# Altium project Alarm-Clock-v1.1.PrjPcb (part 4 of 4)

## Sheet ADC-GPIO-Expand-Sheet.SchDoc
size A4; SheetNumber: 6; SheetTotal: 6
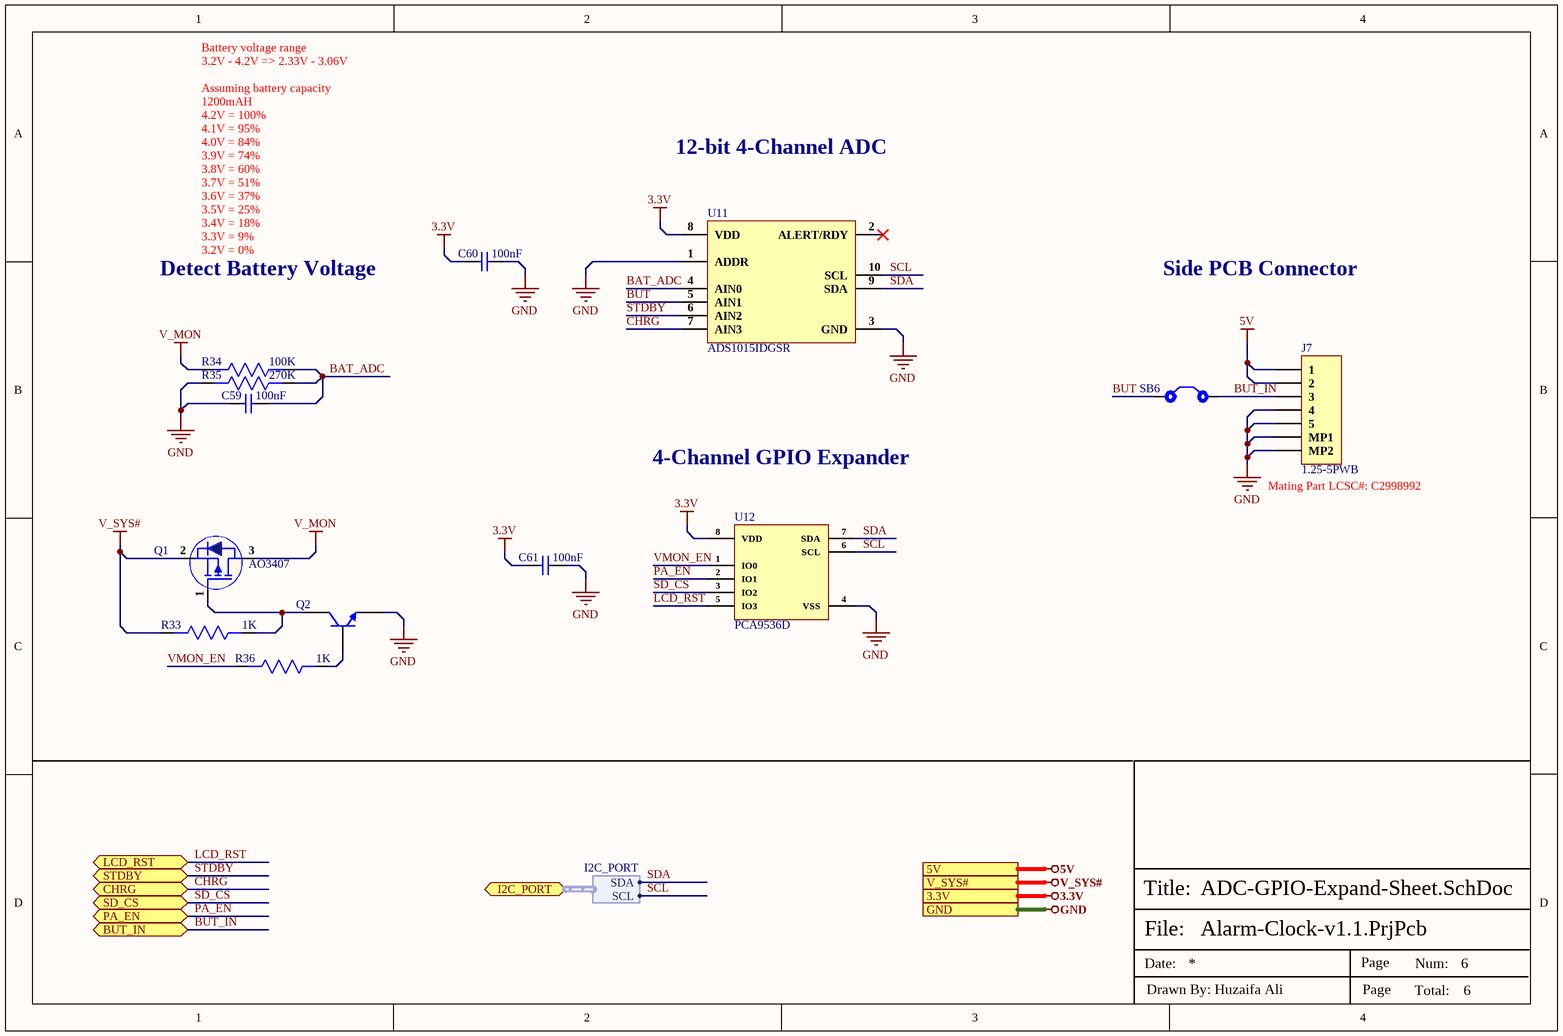
[diagram p5: ADC-GPIO-Expand-Sheet.SchDoc]

### Parts
C59  100nF  [Cap-0402]
C60  100nF  [Cap-0402]
C61  100nF  [Cap-0402]
J7  1.25-5PWB  [1.25-5PWB]
Q1  AO3407  [SOT-23]
Q2  MMBT2222A-7-F  [SOT-23]  (value not drawn)
R33  1K  [Res-0603]
R34  100K  [Res-0603]
R35  270K  [Res-0603]
R36  1K  [Res-0603]
SB6  Solder Bridge 0402  [Solder Bridge 0402]  (value not drawn)
U11  ADS1015IDGSR  [VSSOP-10]
U12  PCA9536D  [SOIC-8]

### Ports
3.3V, 5V, BUT_IN (bidir), CHRG (bidir), GND, I2C_PORT (bidir, harness I2C_PORT), LCD_RST (bidir), PA_EN (bidir), SD_CS (bidir), STDBY (bidir), V_SYS#

### Harnesses
I2C_PORT: SDA, SCL

### Nets
3.3V: C60.1 C61.1 U11.8(VDD) U12.8(VDD) ; port 3.3V
5V: J7.1 J7.2 ; port 5V
GND: C59.1 C60.2 C61.2 J7.4 J7.5 J7.MP1 J7.MP2 Q2.2(E) R35.2 U11.1(ADDR) U11.3(GND) U12.4(VSS) ; port GND
V_MON: Q1.3(D) R34.2
V_SYS#: Q1.2(S) R33.2 ; port V_SYS#
BAT_ADC: C59.2 R34.1 R35.1 U11.4(AIN0)
BUT: SB6.1 U11.5(AIN1)
BUT_IN: J7.3 SB6.2 ; port BUT_IN
CHRG: U11.7(AIN3) ; port CHRG
LCD_RST: U12.5(IO3) ; port LCD_RST
PA_EN: U12.2(IO1) ; port PA_EN
SCL: U11.10(SCL) U12.6(SCL) ; port I2C_PORT.SCL  [project net I2C_PORT.SCL]
SD_CS: U12.3(IO2) ; port SD_CS
SDA: U11.9(SDA) U12.7(SDA) ; port I2C_PORT.SDA  [project net I2C_PORT.SDA]
STDBY: U11.6(AIN2) ; port STDBY
VMON_EN: R36.2 U12.1(IO0)
NetQ1_1: Q1.1(G) Q2.3(C) R33.1
NetQ2_1: Q2.1(B) R36.1

Not connected (* = marked no-connect by the designer): U11 2(ALERT/RDY)*

### Notes on the sheet
- 12-bit 4-Channel ADC
- Battery voltage range
  3.2V - 4.2V => 2.33V - 3.06V
  Assuming battery capacity 1200mAH
  4.2V = 100%
  4.1V = 95%
  4.0V = 84%
  3.9V = 74%
  3.8V = 60%
  3.7V = 51%
  3.6V = 37%
  3.5V = 25%
  3.4V = 18%
  3.3V = 9%
  3.2V = 0%
- Detect Battery Voltage
- Side PCB Connector
- 4-Channel GPIO Expander
- (near J7) Mating Part LCSC#: C2998992
- File:
- Title:
- Date:
- Page
- Num:
- Total:
- Drawn By: Huzaifa Ali

### Library data of the parts
C59-C61 = CC0402KRX5R8BB104: CAP CER 0.1UF 25V X5R 0402; Manufacturer: Yageo; Tolerance: 10%; Item Type: Capacitor; Supplier 1: Digi-Key; Manufacturer Part Number: CC0402KRX5R8BB104; RoHS: Yes; Category: Ceramic Capacitors; Stock 1: 4598218; Pricing 1: 1=0.10000, 10=0.03800, 50=0.02100, 100=0.01710, 500=0.01224, 1000=0.00961, 2500=0.00874, 5000=0.00804 (USD); Mount: Surface Mount; Case/Package: 0402; Case Code (Metric): 1005; Case Code (Imperial): 0402; Min Operating Temperature: -55°C; Max Operating Temperature: 85°C; Voltage Rating: 25V; Packaging: Tape and Reel; Capacitance: 100nF; Voltage Rating (DC): 25V; Dielectric: X5R; Resistor Type: Ceramic; Series: CC; Length: 0.039inch; Width: 0.02inch; Thickness: 0.022inch; Depth: 0.5mm; Lead Free: Lead Free; Halogen Free: Halogen Free; RoHS Compliant: Yes; ComponentLink1URL: http://www.mouser.com/ds/2/447/UPY-GPHC_X5R_4V-to-50V_25-1131599.pdf?src-supplier=Mouser; ComponentLink1Description: http://www.mouser.com/ds/2/447/UPY-GPHC_X5R_4V-to-50V_25-1131599.pdf?src-supplier=Mouser; ComponentLink2URL: http://www.yageo.com/documents/recent/UPY-GPHC_X5R_4V-to-50V-16.pdf?src-supplier=Future+Electronics; ComponentLink2Description: http://www.yageo.com/documents/recent/UPY-GPHC_X5R_4V-to-50V-16.pdf?src-supplier=Future+Electronics; ComponentLink3URL: http://www.yageo.com/documents/recent/UPY-GPHC_X5R_4V-to-50V_25.pdf?src-supplier=Digi-Key; ComponentLink3Description: http://www.yageo.com/documents/recent/UPY-GPHC_X5R_4V-to-50V_25.pdf?src-supplier=Digi-Key; Supplier Part Number 1: 311-1697-1-ND; LCSC Part Number: C106256
J7 = 1.25-5PWB: 1x5P 1 1.25mm Male pin 5 -25℃~+85℃ Surface Mount SMD,P=1.25mm Wire To Board / Wire To Wire Connector ROHS; Manufacturer: DEALON; Item Type: JST Right Angle; Manufacturer Part Number: 1.25-5PWB; Package: SMD,P=1.25mm; LCSC Part Number: C2905012; ComponentLink1Description: LCSC; ComponentLink1URL: https://www.lcsc.com/product-detail/Wire-To-Board-Wire-To-Wire-Connector_DEALON-1-25-5PWB_C2905012.html
Q1 = AO3407: 30V 4.1A 60mΩ@10V,4.1A 350mW 3V@250uA P Channel SOT-23 MOSFETs ROHS; Manufacturer: Guangdong Hottech; Item Type: Mosfet; Manufacturer Part Number: AO3407; Package: SOT-23; LCSC Part Number: C181093; ComponentLink1Description: LCSC; ComponentLink1URL: https://www.lcsc.com/product-detail/MOSFETs_Guangdong-Hottech-AO3407_C181093.html
Q2 = MMBT2222A-7-F: TRANS NPN 40V 0.6A SMD SOT23-3; Manufacturer: Diodes; Max Power Dissipation: 300mW; Collector Base Voltage (VCBO): 75V; Max Collector Current: 600mA; hFE Min: 100; Frequency: 300MHz; Number of Elements: 1; Emitter Base Voltage (VEBO): 6V; Collector Emitter Saturation Voltage: 1V; Power Dissipation: 350mW; Element Configuration: Single; Current: 1A; Supplier 1: Digi-Key; Manufacturer Part Number: MMBT2222A-7-F; Stock 1: 2471182; Pricing 1: 1=0.15, 10=0.134, 100=0.0729, 500=0.04486, 1000=0.03059 (USD); Mount: Surface Mount; Case/Package: SOT-23; Number of Pins: 3; Weight: 0.000282oz; Contact Plating: Matte,Tin; Min Operating Temperature: -55°C; Max Operating Temperature: 150°C; Packaging: Tape and Reel; Collector Emitter Voltage (VCEO): 40V; Polarity: NPN; Voltage Rating (DC): 40V; Package Quantity: 3000; Continuous Collector Current: 600mA; Collector Emitter Breakdown Voltage: 40V; Transition Frequency: 300MHz; Max Breakdown Voltage: 40V; Max Frequency: 300MHz; Termination: SMD/SMT; Gain Bandwidth Product: 300MHz; Current Rating: 600mA; Voltage: 40V; Length: 3.05mm; Height: 1mm; Width: 1.4mm; Radiation Hardening: No; Lead Free: Lead Free; REACH SVHC: No SVHC; ComponentLink1URL: http://www.diodes.com/datasheets/ds30041.pdf?src-supplier=Future+Electronics; ComponentLink1Description: http://www.diodes.com/datasheets/ds30041.pdf?src-supplier=Future+Electronics; ComponentLink2URL: http://www.diodes.com/datasheets/ds30041.pdf?src-supplier=Avnet; ComponentLink2Description: http://www.diodes.com/datasheets/ds30041.pdf?src-supplier=Avnet; ComponentLink3URL: https://www.verical.com/server-webapp/html/getDatasheet?partID=82692&src-supplier=Verical; ComponentLink3Description: https://www.verical.com/server-webapp/html/getDatasheet?partID=82692&src-supplier=Verical; ComponentLink4URL: https://www.diodes.com/assets/Datasheets/ds30041.pdf?src-supplier=Digi-Key; ComponentLink4Description: https://www.diodes.com/assets/Datasheets/ds30041.pdf?src-supplier=Digi-Key; ComponentLink5URL: http://www.diodes.com/datasheets/ds30041.pdf?src-supplier=Avnet+Europe; ComponentLink5Description: http://www.diodes.com/datasheets/ds30041.pdf?src-supplier=Avnet+Europe; ComponentLink6URL: http://www.diodes.com/datasheets/ds30041.pdf?src-supplier=Element14; ComponentLink6Description: http://www.diodes.com/datasheets/ds30041.pdf?src-supplier=Element14; Supplier Part Number 1: MMBT2222A-FDIDKR-ND; LCSC Part Number: C94515
R33 R36 = RC0603FR-071KL: RES SMD 1K OHM 1% 1/10W 0603; Manufacturer: Yageo; Resistance: 1kR; Temperature Coefficient: 100ppm/°C; Power Rating: 100mW; Voltage Rating: 50V; ComponentLink1URL: https://www.verical.com/server-webapp/html/getDatasheet?partID=409289&src-supplier=Verical; ComponentLink1Description: https://www.verical.com/server-webapp/html/getDatasheet?partID=409289&src-supplier=Verical; Supplier 1: Digi-Key; Manufacturer Part Number: RC0603FR-071KL; Stock 1: 21472395; Pricing 1: 1=0.1, 10=0.023, 100=0.0094, 1000=0.0042, 2500=0.0037 (USD); Case/Package: 0603; Contact Plating: Tin,Matte; Case Code (Imperial): 0603; Case Code (Metric): 1608; Min Operating Temperature: -55°C; Max Operating Temperature: 155°C; Tolerance: 1%; Composition: Thick Film; Packaging: Tape and Reel; Termination: SMD/SMT; Military Standard: Not; Length: 1.6mm; Height: 0.45mm; Depth: 0.8mm; Radiation Hardening: No; REACH SVHC: No SVHC; Lead Free: Lead Free; ComponentLink2URL: http://documents.rs-components.com/techlib://itc_doclist_GB.htm?stockno=5048928&src-supplier=RSComponents; ComponentLink2Description: http://documents.rs-components.com/techlib://itc_doclist_GB.htm?stockno=5048928&src-supplier=RSComponents; ComponentLink3URL: http://www.yageo.com/documents/recent/PYu-RC0603_51_RoHS_L_4.pdf?src-supplier=Avnet+Europe; ComponentLink3Description: http://www.yageo.com/documents/recent/PYu-RC0603_51_RoHS_L_4.pdf?src-supplier=Avnet+Europe; ComponentLink4URL: http://www.farnell.com/datasheets/2167052.pdf?src-supplier=Element14; ComponentLink4Description: http://www.farnell.com/datasheets/2167052.pdf?src-supplier=Element14; ComponentLink5URL: http://www.farnell.com/datasheets/1868787.pdf?src-supplier=Element14; ComponentLink5Description: http://www.farnell.com/datasheets/1868787.pdf?src-supplier=Element14; ComponentLink6URL: http://www.yageo.com/documents/recent/PYu-RC_Group_51_RoHS_L_2.pdf?src-supplier=Avnet; ComponentLink6Description: http://www.yageo.com/documents/recent/PYu-RC_Group_51_RoHS_L_2.pdf?src-supplier=Avnet; ComponentLink7URL: https://www.verical.com/server-webapp/html/getDatasheet?partID=404327&src-supplier=Verical; ComponentLink7Description: https://www.verical.com/server-webapp/html/getDatasheet?partID=404327&src-supplier=Verical; ComponentLink8URL: http://www.farnell.com/datasheets/443971.pdf?src-supplier=Element14; ComponentLink8Description: http://www.farnell.com/datasheets/443971.pdf?src-supplier=Element14; Supplier Part Number 1: 311-1.00KHRDKR-ND; LCSC Part Number: C22548
R34 = RT0603BRD07100KL: RES SMD 100K OHM 0.1% 1/10W 0603; Manufacturer: Yageo; Resistance: 100kR; Temperature Coefficient: 25ppm/°C; Voltage Rating (DC): 75V; Power Rating: 100mW; Supplier 1: Digi-Key; Manufacturer Part Number: RT0603BRD07100KL; Stock 1: 53395; Pricing 1: 1=0.39, 10=0.332, 100=0.1298, 1000=0.05435, 2500=0.04982 (USD); Mount: Surface Mount; Case/Package: 0603; Case Code (Imperial): 0603; Case Code (Metric): 1608; Min Operating Temperature: -55°C; Max Operating Temperature: 125°C; Tolerance: 0.1%; Composition: Thin Film; Packaging: Tape and Reel; Voltage Rating: 75V; Package Quantity: 5000; Termination: SMD/SMT; Number of Terminations: 2; Military Standard: Not; Max Power Dissipation: 100mW; Working Voltage: 75V; Features: Moisture Resistant; Length: 1.6mm; Height: 0.022inch; Width: 0.031inch; Depth: 0.8mm; Lead Free: Lead Free; ComponentLink1URL: http://documents.rs-components.com/techlib://itc_doclist_GB.htm?stockno=6174810&src-supplier=RSComponents; ComponentLink1Description: http://documents.rs-components.com/techlib://itc_doclist_GB.htm?stockno=6174810&src-supplier=RSComponents; Supplier Part Number 1: YAG1235CT-ND; LCSC Part Number: C122538
R35 = RC0603DR-07270KL: RES 270K OHM 0.5% 1/10W 0603; Manufacturer: Yageo; Additional Feature: LASER TRIMMABLE; Power: 100mW; Rated Temperature: 70°C; Value: 270kR; Temperature Coefficient: 100ppm/°C; Working Voltage: 75V; Package Height: 0.45mm; Package Length: 1.6mm; Package Width: 0.8mm; Item Type: Resistor; Supplier 1: Mouser; Manufacturer Part Number: RC0603DR-07270KL; RoHS: Yes; Category: Chip SMD Resistors; Stock 1: 13684; Pricing 1: 1=0.21000, 10=0.07000, 50=0.07000, 100=0.02900, 1000=0.01500, 10000=0.00900 (USD); Mounting Technology: Surface Mount; Pins: 2; Package Shape: Rectangular; Case/Package: 0603; Terminal Finish: Nickel; Min Operating Temperature: -55°C; Max Operating Temperature: 155°C; Tolerance: 0.5%; JESD-609 Code: e3; Resistor Type: FIXED RESISTOR; Construction: Chip; Package Style: SMTMeter; Packaging: Tape and Reel; Technology: METAL GLAZE/THICK FILM; Termination: Wraparound; Reach SVHC Compliant: Yes; RoHS Compliant: Yes; ComponentLink1URL: https://datasheet.ciiva.com:443/pdfs/VipMasterIC/IC/YAGO/YAGO-S-A0008145938/YAGO-S-A0008145938-1.pdf?src-supplier=IHS+Markit; ComponentLink1Description: https://datasheet.ciiva.com:443/pdfs/VipMasterIC/IC/YAGO/YAGO-S-A0008145938/YAGO-S-A0008145938-1.pdf?src-supplier=IHS+Markit; ComponentLink2URL: http://www.yageo.com.tw/exep/pages/download/literatures/PYu-R_INT-thick_7.pdf?src-supplier=Digi-Key; ComponentLink2Description: http://www.yageo.com.tw/exep/pages/download/literatures/PYu-R_INT-thick_7.pdf?src-supplier=Digi-Key; Supplier Part Number 1: 603-RC0603DR-07270KL; LCSC Part Number: C724006
SB6 = Solder Bridge 0402: Solder Bridge ON; Manufacturer Part Number: Solder Bridge; Item Type: Solder Bridge
U11 = ADS1015IDGSR: IC ADC 12BIT SIGMA-DELTA 10VSSOP; Manufacturer: Texas Instruments; Operating Supply Voltage: 3.3V; Min Supply Voltage: 2V; Max Supply Voltage: 5.5V; Interface: I2C; Number of Converters: 1; Resolution: 12b; Number of Bits: 12; Sampling Rate: 3.3KS/s; Polarity: Bipolar; Integral Nonlinearity (INL): 0.5LSB; Supply Type: Single; Number of Inputs: 4; Power Dissipation: 900uW; Supplier 1: Digi-Key; Manufacturer Part Number: ADS1015IDGSR; RoHS: Yes; Category: Analog to Digital Converters (ADCs); Pricing 1: 1=3.09000, 10=2.77500, 25=2.62360, 100=2.27370, 250=2.15712, 500=1.93556, 1000=1.65000 (USD); Case/Package: VSSOP; Number of Pins: 10; Contact Plating: Gold; Min Operating Temperature: -40°C; Max Operating Temperature: 125°C; Packaging: Tape and Reel; Package Quantity: 2500; Number of A/D Converters: 1; Number of Elements: 1; Conversion Rate: 3.3KS/s; Max Supply Voltage (DC): 5.5V; Min Supply Voltage (DC): 2V; Series: -; Radiation Hardening: No; Reach SVHC Compliant: Yes; Lead Free: Lead Free; RoHS Compliant: Yes; ComponentLink1URL: https://datasheet.ciiva.com/14260/sbas473c-14260076.pdf?src-supplier=Avnet; ComponentLink1Description: https://datasheet.ciiva.com/14260/sbas473c-14260076.pdf?src-supplier=Avnet; ComponentLink2URL: https://datasheet.ciiva.com/6662/ads1013-6662716.pdf?src-supplier=Digi-Key; ComponentLink2Description: https://datasheet.ciiva.com/6662/ads1013-6662716.pdf?src-supplier=Digi-Key; Supplier Part Number 1: 296-41185-1-ND; LCSC Part Number: C193969; Item Type: IC
U12 = PCA9536D: 4 400kHz I²C, SMBus SOIC-8 I/O Expanders ROHS; Manufacturer: NXP Semicon; Item Type: IC; Manufacturer Part Number: PCA9536D; Package: SOIC-8; LCSC Part Number: C129522; ComponentLink1Description: LCSC; ComponentLink1URL: https://www.lcsc.com/product-detail/I-O-Expanders_NXP-Semicon-PCA9536D_C129522.html

## Nets that join several sheets
3.3V: LCD-Sheet (7 pins), Audio-Sheet (FB2.1 FB3.1 R25.1), Power-Sheet (6 pins), Controller-Sheet (10 pins), ADC-GPIO-Expand-Sheet (C60.1 C61.1 U11.8 U12.8)
5V: Power-Sheet (6 pins), ADC-GPIO-Expand-Sheet (J7.1 J7.2)
AGND: Audio-Sheet (40 pins), Power-Sheet (5 pins)
CODEC_3V3: Audio-Sheet (C44.1 C45.1 R24.1), Power-Sheet (C7.1 P5.1 U2.5)
GND: LCD-Sheet (14 pins), Power-Sheet (24 pins), Controller-Sheet (17 pins), ADC-GPIO-Expand-Sheet (12 pins)
V_SYS#: LCD-Sheet (C18.1 C19.1 L1.1 U8.6), Power-Sheet (FB1.2 SW6.3), ADC-GPIO-Expand-Sheet (Q1.2 R33.2)
BUT_IN: Controller-Sheet (R2.2 SW3.2), ADC-GPIO-Expand-Sheet (J7.3 SB6.2)
CHRG: Power-Sheet (R7.1 U3.7), ADC-GPIO-Expand-Sheet (U11.7)
I2C_PORT.SCL: Audio-Sheet (U9.28), Controller-Sheet (R12.1 U7.34), ADC-GPIO-Expand-Sheet (U11.10 U12.6)
I2C_PORT.SDA: Audio-Sheet (U9.27), Controller-Sheet (R11.1 U7.33), ADC-GPIO-Expand-Sheet (U11.9 U12.7)
I2S_DIN: Audio-Sheet (R21.2), Controller-Sheet (U7.36)
I2S_DOUT: Audio-Sheet (R19.2), Controller-Sheet (U7.37)
I2S_LRCK: Audio-Sheet (R20.2), Controller-Sheet (U7.26)
I2S_MCLK: Audio-Sheet (R17.2), Controller-Sheet (U7.35)
I2S_SCLK: Audio-Sheet (R18.2), Controller-Sheet (U7.16)
LCD_BL_EN: LCD-Sheet (R14.1 U8.4), Controller-Sheet (U7.31)
LCD_CS: LCD-Sheet (J4.11), Controller-Sheet (U7.32)
LCD_DB1: LCD-Sheet (J4.17), Controller-Sheet (U7.8)
LCD_DB2: LCD-Sheet (J4.18), Controller-Sheet (U7.22)
LCD_DB3: LCD-Sheet (J4.19), Controller-Sheet (U7.21)
LCD_DB4: LCD-Sheet (J4.20), Controller-Sheet (U7.20)
LCD_DB5: LCD-Sheet (J4.21), Controller-Sheet (U7.19)
LCD_DB6: LCD-Sheet (J4.22), Controller-Sheet (U7.18)
LCD_DB7: LCD-Sheet (J4.23), Controller-Sheet (U7.17)
LCD_DB8: LCD-Sheet (J4.24), Controller-Sheet (U7.12)
LCD_DB9: LCD-Sheet (J4.25), Controller-Sheet (U7.7)
LCD_DB10: LCD-Sheet (J4.26), Controller-Sheet (U7.6)
LCD_DB11: LCD-Sheet (J4.27), Controller-Sheet (U7.5)
LCD_DB13: LCD-Sheet (J4.29), Controller-Sheet (U7.4)
LCD_DB14: LCD-Sheet (J4.30), Controller-Sheet (U7.15)
LCD_DB15: LCD-Sheet (J4.31), Controller-Sheet (U7.38)
LCD_DB16: LCD-Sheet (J4.32), Controller-Sheet (U7.39)
LCD_DB17: LCD-Sheet (J4.33), Controller-Sheet (R9.2 SW2.1 SW2.2 U7.27)
LCD_DE: LCD-Sheet (J4.13), Controller-Sheet (U7.11)
LCD_HSYNC: LCD-Sheet (J4.15), Controller-Sheet (U7.9)
LCD_PCLK: LCD-Sheet (J4.12), Controller-Sheet (U7.23)
LCD_RST: LCD-Sheet (J4.6 R15.1), ADC-GPIO-Expand-Sheet (U12.5)
LCD_SCK: LCD-Sheet (J4.10), Controller-Sheet (U7.25)
LCD_SDA: LCD-Sheet (J4.9), Controller-Sheet (U7.24)
LCD_VSYNC: LCD-Sheet (J4.14), Controller-Sheet (U7.10)
PA_EN: Audio-Sheet (R31.2 U10.1), ADC-GPIO-Expand-Sheet (U12.2)
SD_CS: Controller-Sheet (J3.2), ADC-GPIO-Expand-Sheet (U12.3)
STDBY: Power-Sheet (R6.1 U3.6), ADC-GPIO-Expand-Sheet (U11.6)
USB_D_N: Power-Sheet (D2.2 J1.2), Controller-Sheet (U7.13)
USB_D_P: Power-Sheet (D2.1 J1.3), Controller-Sheet (SW3.1 U7.14)